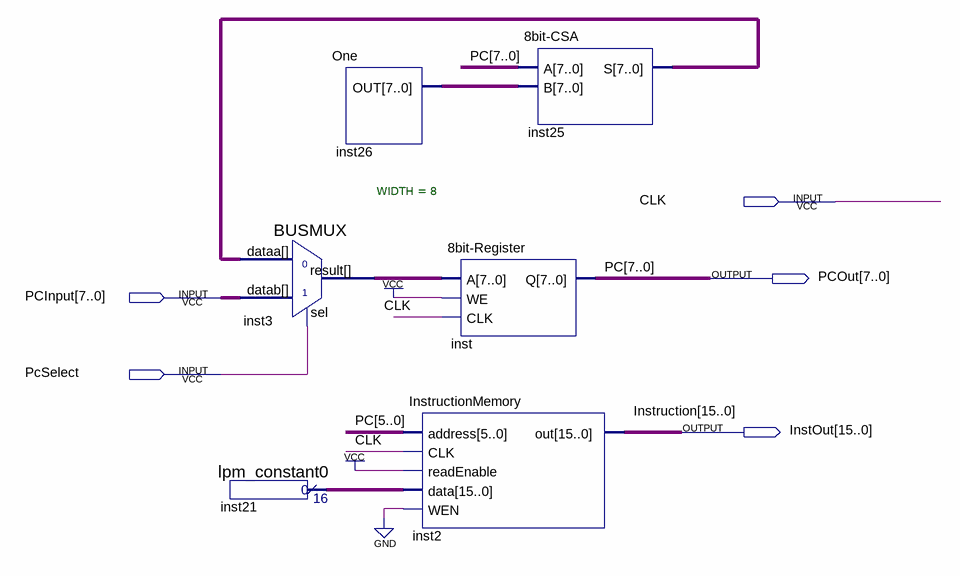
[diagram p0: schematic sheet]
// Quartus schematic IF.bdf as structural Verilog: 6 symbols, 5 pins
module IF (
  input  CLK,
  input  [7:0] PCInput,
  input  PcSelect,
  output [7:0] PCOut,
  output [15:0] InstOut
);

  wire [7:0] inst3_result, inst25_s, inst26_out;
  wire [15:0] inst21_result;

  lpm_constant0 inst21 (.result(inst21_result));
  BUSMUX #(.WIDTH(8)) inst3 (.datab(PCInput), .sel(PcSelect), .dataa(inst25_s), .result(inst3_result));
  One inst26 (.OUT(inst26_out));
  \8bit-Register  inst (.A(inst3_result), .WE(1'b1), .CLK(CLK), .Q(PCOut));
  InstructionMemory inst2 (
    .address(PCOut[5:0]), .CLK(CLK), .readEnable(1'b1), .data(inst21_result), .WEN(1'b0), .out(InstOut));
  \8bit-CSA  inst25 (.A(PCOut), .B(inst26_out), .S(inst25_s));

  // Other names for the same wires on the sheet: Instruction[15:0] = InstOut; PC[7:0] = PCOut
endmodule
